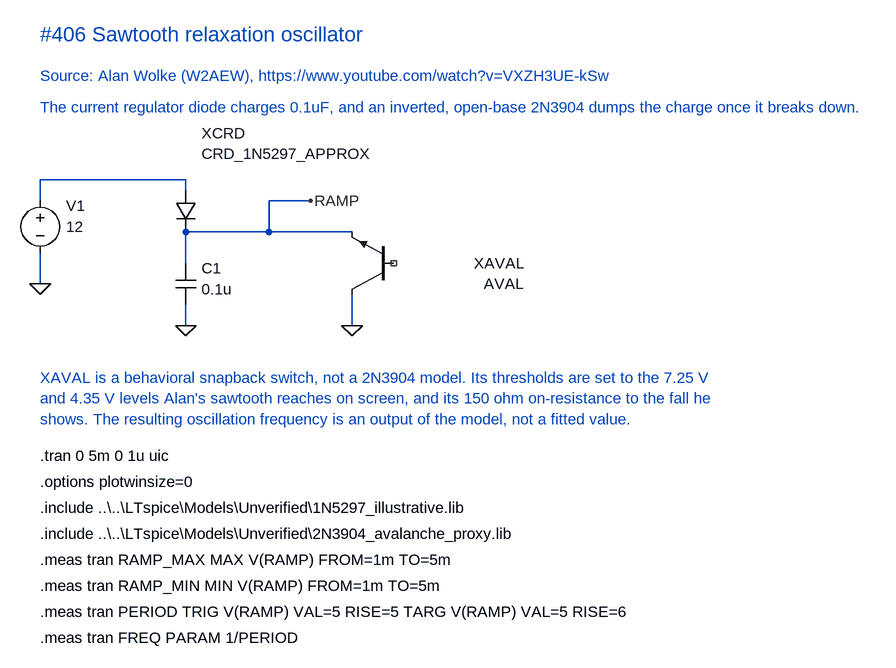
[diagram p0: schematic Avalanche sawtooth oscillator.asc]
Avalanche sawtooth oscillator.asc, the LTspice schematic file:
Version 4.1
SHEET 1 1200 1050
WIRE 96 272 96 304
WIRE 320 272 96 272
WIRE 320 288 320 272
WIRE 320 400 320 352
WIRE 576 352 320 352
WIRE 448 304 448 352
WIRE 512 304 448 304
WIRE 96 432 96 384
WIRE 320 496 320 464
WIRE 576 496 576 448
FLAG 96 432 0
FLAG 320 496 0
FLAG 576 496 0
FLAG 512 304 RAMP
SYMBOL voltage 96 288 R0
WINDOW 0 40 24 Left 2
WINDOW 3 40 56 Left 2
SYMATTR InstName V1
SYMATTR Value 12
SYMBOL diode 304 288 R0
WINDOW 0 40 -88 Left 2
WINDOW 3 40 -56 Left 2
SYMATTR Prefix X
SYMATTR InstName XCRD
SYMATTR Value CRD_1N5297_APPROX
SYMBOL cap 304 400 R0
WINDOW 0 40 8 Left 2
WINDOW 3 40 40 Left 2
SYMATTR InstName C1
SYMATTR Value 0.1u
SYMBOL npn 640 448 R180
WINDOW 0 -200 48 Left 2
WINDOW 3 -200 16 Left 2
SYMATTR Prefix X
SYMATTR InstName XAVAL
SYMATTR Value AVAL
TEXT 96 48 Left 3 ;#406 Sawtooth relaxation oscillator
TEXT 96 112 Left 2 ;Source: Alan Wolke (W2AEW), https://www.youtube.com/watch?v=VXZH3UE-kSw
TEXT 96 160 Left 2 ;The current regulator diode charges 0.1uF, and an inverted, open-base 2N3904 dumps the charge once it breaks down.
TEXT 96 576 Left 2 ;XAVAL is a behavioral snapback switch, not a 2N3904 model. Its thresholds are set to the 7.25 V
TEXT 96 608 Left 2 ;and 4.35 V levels Alan's sawtooth reaches on screen, and its 150 ohm on-resistance to the fall he
TEXT 96 640 Left 2 ;shows. The resulting oscillation frequency is an output of the model, not a fitted value.
TEXT 96 696 Left 2 !.tran 0 5m 0 1u uic
TEXT 96 736 Left 2 !.options plotwinsize=0
TEXT 96 776 Left 2 !.include ..\..\LTspice\Models\Unverified\1N5297_illustrative.lib
TEXT 96 816 Left 2 !.include ..\..\LTspice\Models\Unverified\2N3904_avalanche_proxy.lib
TEXT 96 856 Left 2 !.meas tran RAMP_MAX MAX V(RAMP) FROM=1m TO=5m
TEXT 96 896 Left 2 !.meas tran RAMP_MIN MIN V(RAMP) FROM=1m TO=5m
TEXT 96 936 Left 2 !.meas tran PERIOD TRIG V(RAMP) VAL=5 RISE=5 TARG V(RAMP) VAL=5 RISE=6
TEXT 96 976 Left 2 !.meas tran FREQ PARAM 1/PERIOD

The netlist it stands for:
* Avalanche sawtooth oscillator.asc
V1 N001 0 12
X§XCRD N001 RAMP CRD_1N5297_APPROX  ; pins + -
C1 RAMP 0 0.1u
X§XAVAL 0 NC_01 RAMP AVAL  ; pins C B E
* #406 Sawtooth relaxation oscillator
* Source: Alan Wolke (W2AEW), https://www.youtube.com/watch?v=VXZH3UE-kSw
* The current regulator diode charges 0.1uF, and an inverted, open-base 2N3904 dumps the charge once it breaks down.
* XAVAL is a behavioral snapback switch, not a 2N3904 model. Its thresholds are set to the 7.25 V
* and 4.35 V levels Alan's sawtooth reaches on screen, and its 150 ohm on-resistance to the fall he
* shows. The resulting oscillation frequency is an output of the model, not a fitted value.
.tran 0 5m 0 1u uic
.options plotwinsize=0
.include ..\..\LTspice\Models\Unverified\1N5297_illustrative.lib
.include ..\..\LTspice\Models\Unverified\2N3904_avalanche_proxy.lib
.meas tran RAMP_MAX MAX V(RAMP) FROM=1m TO=5m
.meas tran RAMP_MIN MIN V(RAMP) FROM=1m TO=5m
.meas tran PERIOD TRIG V(RAMP) VAL=5 RISE=5 TARG V(RAMP) VAL=5 RISE=6
.meas tran FREQ PARAM 1/PERIOD
.backanno
.end